# Altium project BMS_ilk_cizim.PrjPcb
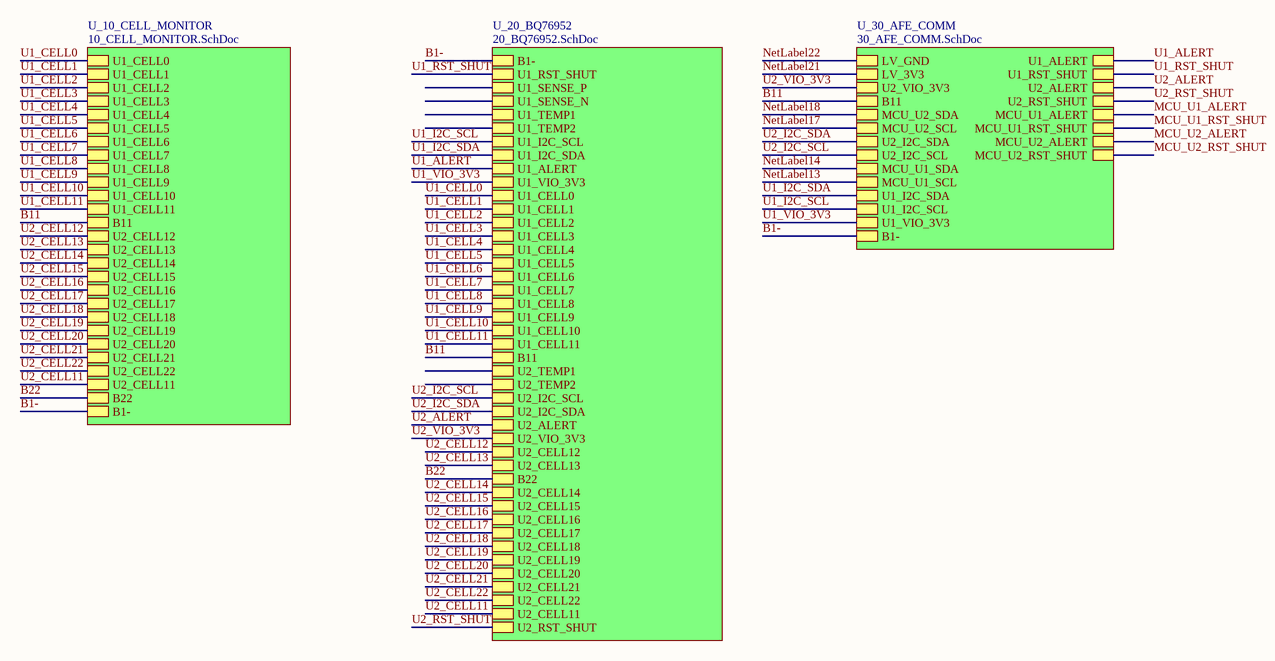
[diagram p0: 00_BMS_TOP.SchDoc]
4 sheets, 101 parts. Net scope: hierarchical (ports join the sheet entries above them; power ports are global).
Sheets:
  00_BMS_TOP.SchDoc
    U_10_CELL_MONITOR = 10_CELL_MONITOR.SchDoc
    U_20_BQ76952 = 20_BQ76952.SchDoc
    U_30_AFE_COMM = 30_AFE_COMM.SchDoc

## Sheet 00_BMS_TOP.SchDoc
size A4; SheetNumber: 1; SheetTotal: 4

### Sub-sheets
U_10_CELL_MONITOR = 10_CELL_MONITOR.SchDoc: U1_CELL0, U1_CELL1, U1_CELL2, U1_CELL3, U1_CELL4, U1_CELL5, U1_CELL6, U1_CELL7, U1_CELL8, U1_CELL9, U1_CELL10, U1_CELL11, B11, U2_CELL12, U2_CELL13, U2_CELL14, U2_CELL15, U2_CELL16, U2_CELL17, U2_CELL18, U2_CELL19, U2_CELL20, U2_CELL21, U2_CELL22, U2_CELL11, B22, B1-
U_20_BQ76952 = 20_BQ76952.SchDoc: B1-, U1_SENSE_P, U1_SENSE_N, U1_TEMP1, U1_TEMP2, U1_I2C_SCL, U1_I2C_SDA, U1_ALERT, U1_VIO_3V3, U1_CELL0, U1_CELL1, U1_CELL2, U1_CELL3, U1_CELL4, U1_CELL5, U1_CELL6, U1_CELL7, U1_CELL8, U1_CELL9, U1_CELL10, U1_CELL11, B11, U2_TEMP1, U2_TEMP2, U2_I2C_SCL, U2_I2C_SDA, U2_ALERT, U2_VIO_3V3, U2_CELL12, U2_CELL13, B22, U2_CELL14, U2_CELL15, U2_CELL16, U2_CELL17, U2_CELL18, U2_CELL19, U2_CELL20, U2_CELL21, U2_CELL22, U2_CELL11, U2_RST_SHUT, U1_RST_SHUT
U_30_AFE_COMM = 30_AFE_COMM.SchDoc: LV_GND, LV_3V3, U2_VIO_3V3, B11, MCU_U2_SDA, MCU_U2_SCL, U2_I2C_SDA, U2_I2C_SCL, MCU_U1_SDA, MCU_U1_SCL, U1_I2C_SDA, U1_I2C_SCL, U1_VIO_3V3, B1-, U2_ALERT, MCU_U2_ALERT, MCU_U2_RST_SHUT, U2_RST_SHUT, U1_ALERT, MCU_U1_ALERT, MCU_U1_RST_SHUT, U1_RST_SHUT

### Nets
B1-: sheet U_10_CELL_MONITOR/B1-, sheet U_20_BQ76952/B1-, sheet U_30_AFE_COMM/B1-
B11: sheet U_10_CELL_MONITOR/B11, sheet U_20_BQ76952/B11, sheet U_30_AFE_COMM/B11
B22: sheet U_10_CELL_MONITOR/B22, sheet U_20_BQ76952/B22
U1_ALERT: sheet U_20_BQ76952/U1_ALERT, sheet U_30_AFE_COMM/U1_ALERT
U1_CELL0: sheet U_10_CELL_MONITOR/U1_CELL0, sheet U_20_BQ76952/U1_CELL0
U1_CELL1: sheet U_10_CELL_MONITOR/U1_CELL1, sheet U_20_BQ76952/U1_CELL1
U1_CELL2: sheet U_10_CELL_MONITOR/U1_CELL2, sheet U_20_BQ76952/U1_CELL2
U1_CELL3: sheet U_10_CELL_MONITOR/U1_CELL3, sheet U_20_BQ76952/U1_CELL3
U1_CELL4: sheet U_10_CELL_MONITOR/U1_CELL4, sheet U_20_BQ76952/U1_CELL4
U1_CELL5: sheet U_10_CELL_MONITOR/U1_CELL5, sheet U_20_BQ76952/U1_CELL5
U1_CELL6: sheet U_10_CELL_MONITOR/U1_CELL6, sheet U_20_BQ76952/U1_CELL6
U1_CELL7: sheet U_10_CELL_MONITOR/U1_CELL7, sheet U_20_BQ76952/U1_CELL7
U1_CELL8: sheet U_10_CELL_MONITOR/U1_CELL8, sheet U_20_BQ76952/U1_CELL8
U1_CELL9: sheet U_10_CELL_MONITOR/U1_CELL9, sheet U_20_BQ76952/U1_CELL9
U1_CELL10: sheet U_10_CELL_MONITOR/U1_CELL10, sheet U_20_BQ76952/U1_CELL10
U1_CELL11: sheet U_10_CELL_MONITOR/U1_CELL11, sheet U_20_BQ76952/U1_CELL11
U1_I2C_SCL: sheet U_20_BQ76952/U1_I2C_SCL, sheet U_30_AFE_COMM/U1_I2C_SCL
U1_I2C_SDA: sheet U_20_BQ76952/U1_I2C_SDA, sheet U_30_AFE_COMM/U1_I2C_SDA
U1_RST_SHUT: sheet U_20_BQ76952/U1_RST_SHUT, sheet U_30_AFE_COMM/U1_RST_SHUT
U1_VIO_3V3: sheet U_20_BQ76952/U1_VIO_3V3, sheet U_30_AFE_COMM/U1_VIO_3V3
U2_ALERT: sheet U_20_BQ76952/U2_ALERT, sheet U_30_AFE_COMM/U2_ALERT
U2_CELL11: sheet U_10_CELL_MONITOR/U2_CELL11, sheet U_20_BQ76952/U2_CELL11
U2_CELL12: sheet U_10_CELL_MONITOR/U2_CELL12, sheet U_20_BQ76952/U2_CELL12
U2_CELL13: sheet U_10_CELL_MONITOR/U2_CELL13, sheet U_20_BQ76952/U2_CELL13
U2_CELL14: sheet U_10_CELL_MONITOR/U2_CELL14, sheet U_20_BQ76952/U2_CELL14
U2_CELL15: sheet U_10_CELL_MONITOR/U2_CELL15, sheet U_20_BQ76952/U2_CELL15
U2_CELL16: sheet U_10_CELL_MONITOR/U2_CELL16, sheet U_20_BQ76952/U2_CELL16
U2_CELL17: sheet U_10_CELL_MONITOR/U2_CELL17, sheet U_20_BQ76952/U2_CELL17
U2_CELL18: sheet U_10_CELL_MONITOR/U2_CELL18, sheet U_20_BQ76952/U2_CELL18
U2_CELL19: sheet U_10_CELL_MONITOR/U2_CELL19, sheet U_20_BQ76952/U2_CELL19
U2_CELL20: sheet U_10_CELL_MONITOR/U2_CELL20, sheet U_20_BQ76952/U2_CELL20
U2_CELL21: sheet U_10_CELL_MONITOR/U2_CELL21, sheet U_20_BQ76952/U2_CELL21
U2_CELL22: sheet U_10_CELL_MONITOR/U2_CELL22, sheet U_20_BQ76952/U2_CELL22
U2_I2C_SCL: sheet U_20_BQ76952/U2_I2C_SCL, sheet U_30_AFE_COMM/U2_I2C_SCL
U2_I2C_SDA: sheet U_20_BQ76952/U2_I2C_SDA, sheet U_30_AFE_COMM/U2_I2C_SDA
U2_RST_SHUT: sheet U_20_BQ76952/U2_RST_SHUT, sheet U_30_AFE_COMM/U2_RST_SHUT
U2_VIO_3V3: sheet U_20_BQ76952/U2_VIO_3V3, sheet U_30_AFE_COMM/U2_VIO_3V3

## Sheet 10_CELL_MONITOR.SchDoc
size A3; SheetNumber: 2; SheetTotal: 4
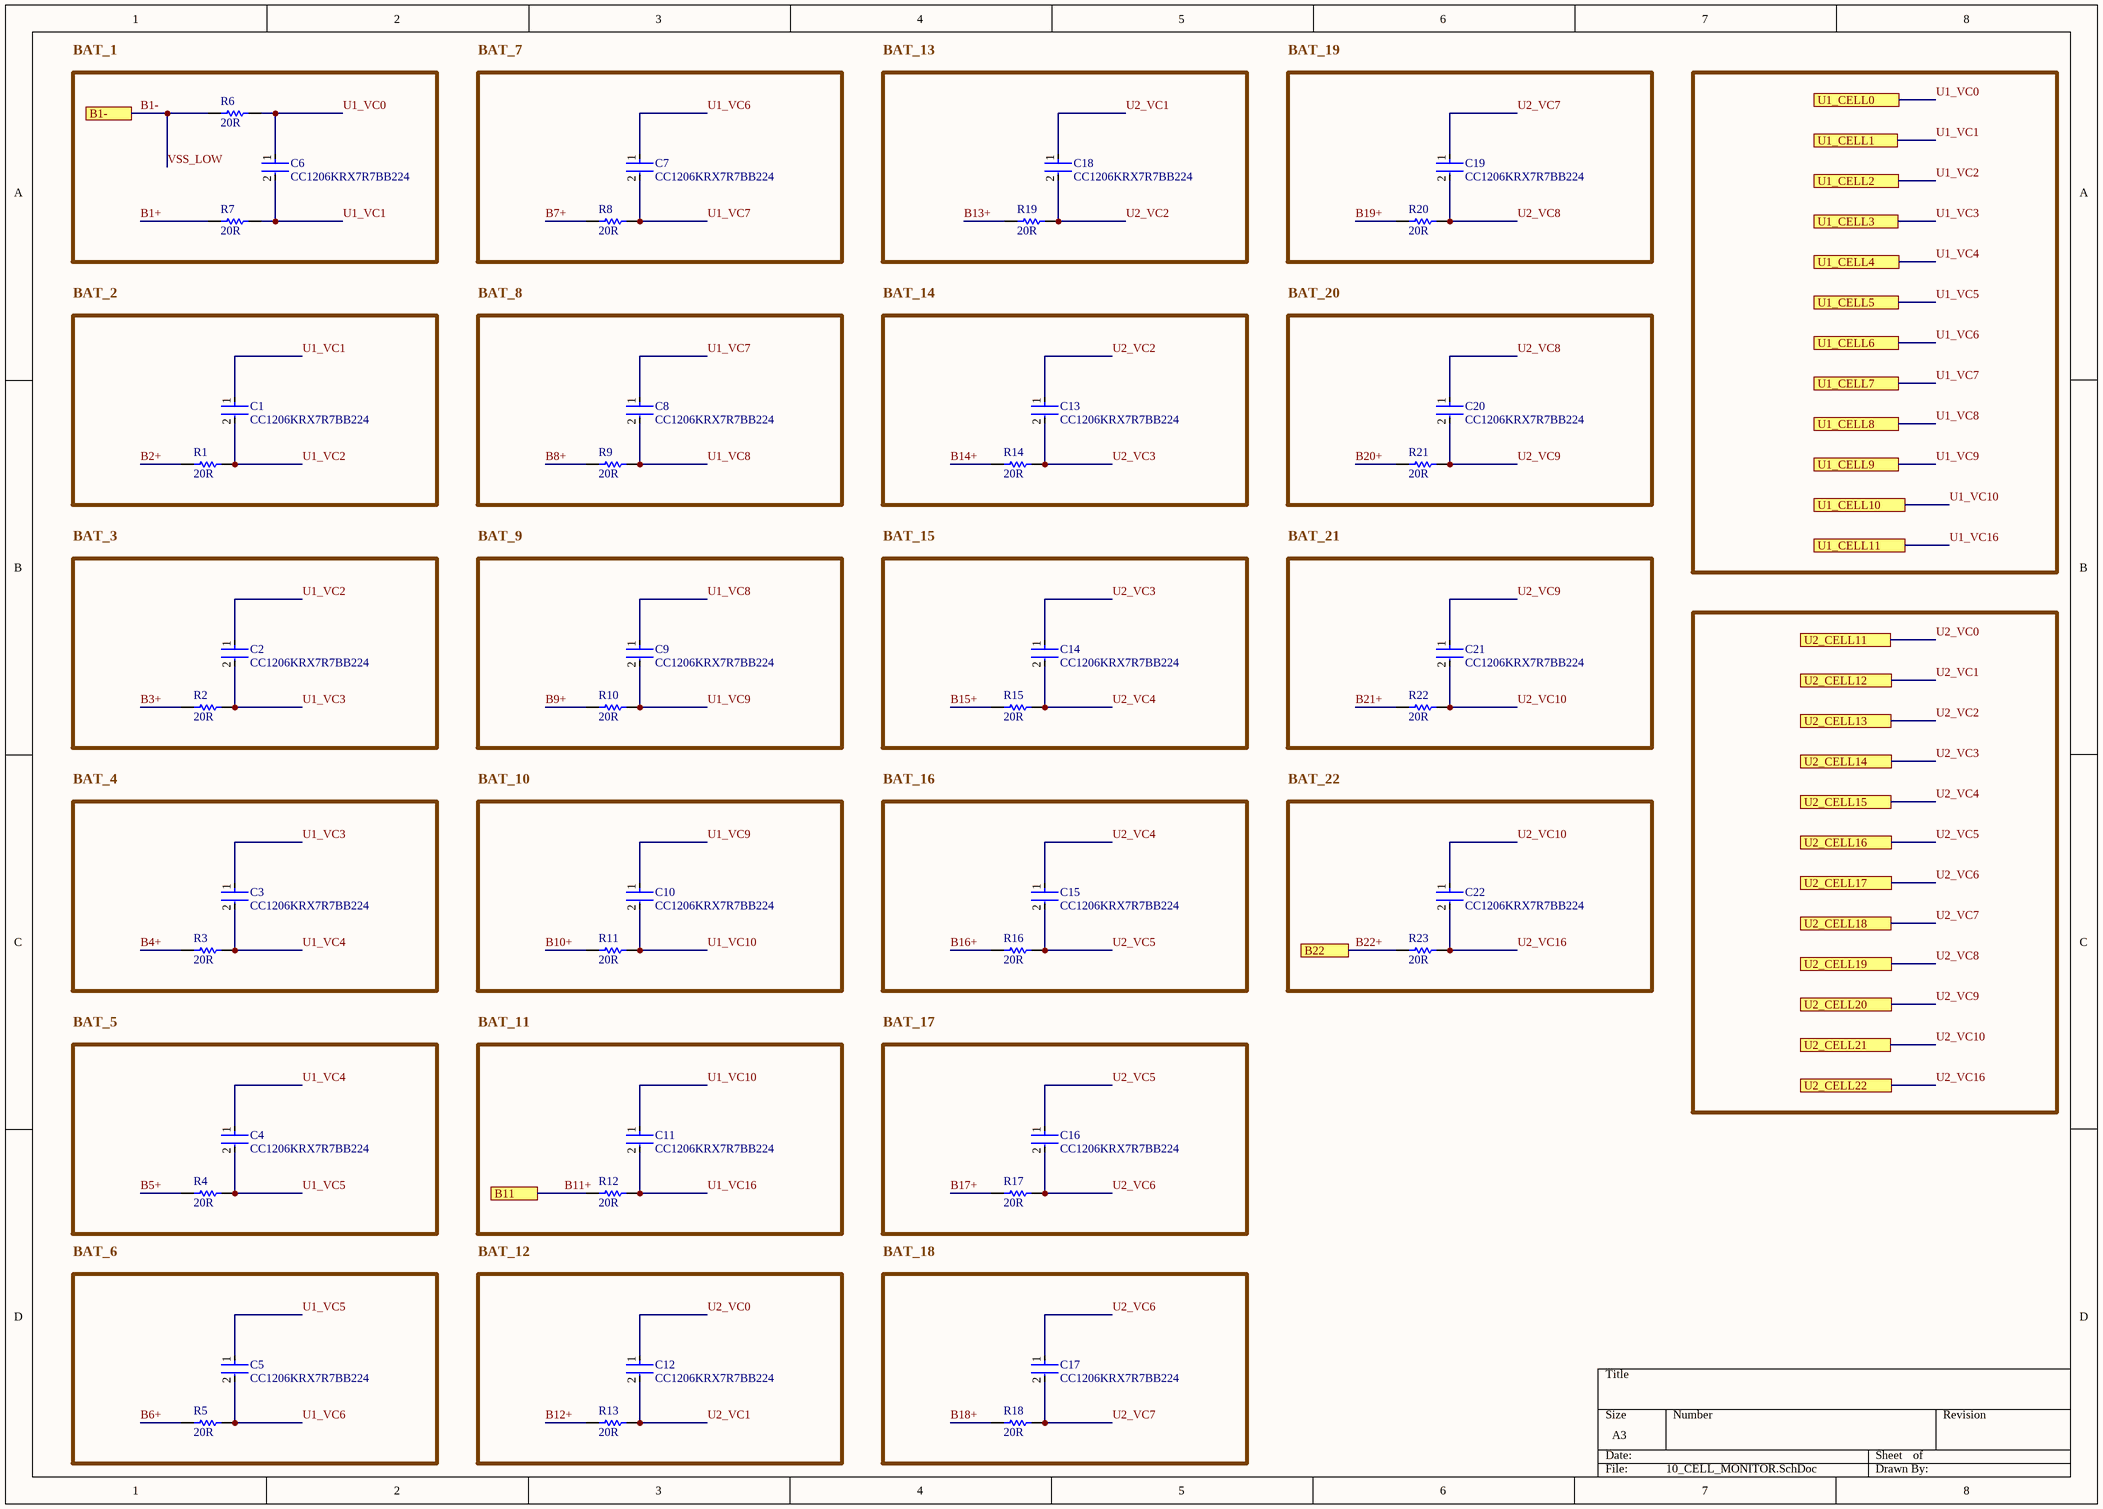
[diagram p1: 10_CELL_MONITOR.SchDoc]

### Parts
C1  CC1206KRX7R7BB224  [FP-CC1206-1_25-MFG]
C2  CC1206KRX7R7BB224  [FP-CC1206-1_25-MFG]
C3  CC1206KRX7R7BB224  [FP-CC1206-1_25-MFG]
C4  CC1206KRX7R7BB224  [FP-CC1206-1_25-MFG]
C5  CC1206KRX7R7BB224  [FP-CC1206-1_25-MFG]
C6  CC1206KRX7R7BB224  [FP-CC1206-1_25-MFG]
C7  CC1206KRX7R7BB224  [FP-CC1206-1_25-MFG]
C8  CC1206KRX7R7BB224  [FP-CC1206-1_25-MFG]
C9  CC1206KRX7R7BB224  [FP-CC1206-1_25-MFG]
C10  CC1206KRX7R7BB224  [FP-CC1206-1_25-MFG]
C11  CC1206KRX7R7BB224  [FP-CC1206-1_25-MFG]
C12  CC1206KRX7R7BB224  [FP-CC1206-1_25-MFG]
C13  CC1206KRX7R7BB224  [FP-CC1206-1_25-MFG]
C14  CC1206KRX7R7BB224  [FP-CC1206-1_25-MFG]
C15  CC1206KRX7R7BB224  [FP-CC1206-1_25-MFG]
C16  CC1206KRX7R7BB224  [FP-CC1206-1_25-MFG]
C17  CC1206KRX7R7BB224  [FP-CC1206-1_25-MFG]
C18  CC1206KRX7R7BB224  [FP-CC1206-1_25-MFG]
C19  CC1206KRX7R7BB224  [FP-CC1206-1_25-MFG]
C20  CC1206KRX7R7BB224  [FP-CC1206-1_25-MFG]
C21  CC1206KRX7R7BB224  [FP-CC1206-1_25-MFG]
C22  CC1206KRX7R7BB224  [FP-CC1206-1_25-MFG]
R1  20R  [RESC3116X65X40LL10T20]
R2  20R  [RESC3116X65X40LL10T20]
R3  20R  [RESC3116X65X40LL10T20]
R4  20R  [RESC3116X65X40LL10T20]
R5  20R  [RESC3116X65X40LL10T20]
R6  20R  [RESC3116X65X40LL10T20]
R7  20R  [RESC3116X65X40LL10T20]
R8  20R  [RESC3116X65X40LL10T20]
R9  20R  [RESC3116X65X40LL10T20]
R10  20R  [RESC3116X65X40LL10T20]
R11  20R  [RESC3116X65X40LL10T20]
R12  20R  [RESC3116X65X40LL10T20]
R13  20R  [RESC3116X65X40LL10T20]
R14  20R  [RESC3116X65X40LL10T20]
R15  20R  [RESC3116X65X40LL10T20]
R16  20R  [RESC3116X65X40LL10T20]
R17  20R  [RESC3116X65X40LL10T20]
R18  20R  [RESC3116X65X40LL10T20]
R19  20R  [RESC3116X65X40LL10T20]
R20  20R  [RESC3116X65X40LL10T20]
R21  20R  [RESC3116X65X40LL10T20]
R22  20R  [RESC3116X65X40LL10T20]
R23  20R  [RESC3116X65X40LL10T20]

### Ports
B1-, B11, B22, U1_CELL0, U1_CELL1, U1_CELL2, U1_CELL3, U1_CELL4, U1_CELL5, U1_CELL6, U1_CELL7, U1_CELL8, U1_CELL9, U1_CELL10, U1_CELL11, U2_CELL11, U2_CELL12, U2_CELL13, U2_CELL14, U2_CELL15, U2_CELL16, U2_CELL17, U2_CELL18, U2_CELL19, U2_CELL20, U2_CELL21, U2_CELL22

### Nets
B1+: R7.1
B1-: R6.1 ; port B1-  [also labelled VSS_LOW]
B2+: R1.1
B3+: R2.1
B4+: R3.1
B5+: R4.1
B6+: R5.1
B7+: R8.1
B8+: R9.1
B9+: R10.1
B10+: R11.1
B11+: R12.1 ; port B11  [project net B11]
B12+: R13.1
B13+: R19.1
B14+: R14.1
B15+: R15.1
B16+: R16.1
B17+: R17.1
B18+: R18.1
B19+: R20.1
B20+: R21.1
B21+: R22.1
B22+: R23.1 ; port B22  [project net B22]
U1_VC0: C6.1 R6.2 ; port U1_CELL0  [project net U1_CELL0]
U1_VC1: C1.1 C6.2 R7.2 ; port U1_CELL1  [project net U1_CELL1]
U1_VC2: C1.2 C2.1 R1.2 ; port U1_CELL2  [project net U1_CELL2]
U1_VC3: C2.2 C3.1 R2.2 ; port U1_CELL3  [project net U1_CELL3]
U1_VC4: C3.2 C4.1 R3.2 ; port U1_CELL4  [project net U1_CELL4]
U1_VC5: C4.2 C5.1 R4.2 ; port U1_CELL5  [project net U1_CELL5]
U1_VC6: C5.2 C7.1 R5.2 ; port U1_CELL6  [project net U1_CELL6]
U1_VC7: C7.2 C8.1 R8.2 ; port U1_CELL7  [project net U1_CELL7]
U1_VC8: C8.2 C9.1 R9.2 ; port U1_CELL8  [project net U1_CELL8]
U1_VC9: C9.2 C10.1 R10.2 ; port U1_CELL9  [project net U1_CELL9]
U1_VC10: C10.2 C11.1 R11.2 ; port U1_CELL10  [project net U1_CELL10]
U1_VC16: C11.2 R12.2 ; port U1_CELL11  [project net U1_CELL11]
U2_VC0: C12.1 ; port U2_CELL11  [project net U2_CELL11]
U2_VC1: C12.2 C18.1 R13.2 ; port U2_CELL12  [project net U2_CELL12]
U2_VC2: C13.1 C18.2 R19.2 ; port U2_CELL13  [project net U2_CELL13]
U2_VC3: C13.2 C14.1 R14.2 ; port U2_CELL14  [project net U2_CELL14]
U2_VC4: C14.2 C15.1 R15.2 ; port U2_CELL15  [project net U2_CELL15]
U2_VC5: C15.2 C16.1 R16.2 ; port U2_CELL16  [project net U2_CELL16]
U2_VC6: C16.2 C17.1 R17.2 ; port U2_CELL17  [project net U2_CELL17]
U2_VC7: C17.2 C19.1 R18.2 ; port U2_CELL18  [project net U2_CELL18]
U2_VC8: C19.2 C20.1 R20.2 ; port U2_CELL19  [project net U2_CELL19]
U2_VC9: C20.2 C21.1 R21.2 ; port U2_CELL20  [project net U2_CELL20]
U2_VC10: C21.2 C22.1 R22.2 ; port U2_CELL21  [project net U2_CELL21]
U2_VC16: C22.2 R23.2 ; port U2_CELL22  [project net U2_CELL22]

### Notes on the sheet
- Labels drawn without touching a wire or pin: BAT_1, BAT_2, BAT_3, BAT_4, BAT_5, BAT_6, BAT_7, BAT_8, BAT_9, BAT_10, BAT_11, BAT_12, BAT_13, BAT_14, BAT_15, BAT_16, BAT_17, BAT_18, BAT_19, BAT_20, BAT_21, BAT_22

### Library data of the parts
C1-C22 = CMP-1037-04366-2: CAP CER 0.22UF 16V X7R 1206; Manufacturer: Yageo; Automotive Grade: NA; Temperature Coefficient: 15%; Tolerance: 0.1; Value: 220 nF; Material: Ceramic; Temperature Range High: +125°C; Device Class L1: Passive Components; Octopart: https://octopart.com/cc1206krx7r7bb224-yageo-42522915; Automotive: No; Package: CC1206-1.25; Digikey Description: CAP CER 0.22UF 16V X7R 1206; RoHS: TRUE; Temperature Range Low: -55°C; Device Class L2: Capacitors; Manufacturer Part Number: CC1206KRX7R7BB224; Height: 1.45mm; Footprint Url: http://www.yageo.com/exep/pages/download/literatures/UPY-C_GEN_24.pdf; Temperature Characteristic: X7R; ComponentLink2URL: http://www.yageo.com/documents/recent/UPY-NP0X7R_HV_1KV-to-3KV_11.pdf; ComponentLink2Description: Datasheet; Mouser Description: Multilayer Ceramic Capacitors MLCC - SMD/SMT 220nF 16V X7R 10%; Voltage Rating: 16 V; Lead Free: Yes; Temperature: -55°C to +125°C; Capacitance: 220 nF; Category: Cap; Device Class L3: Ceramic Capacitors
R1-R23 = CMP-2003-04964-1: Part Number: RT1206FRE0720RL; Manufacturer: Yageo

## Sheet 20_BQ76952.SchDoc
size A3; SheetNumber: 3; SheetTotal: 4
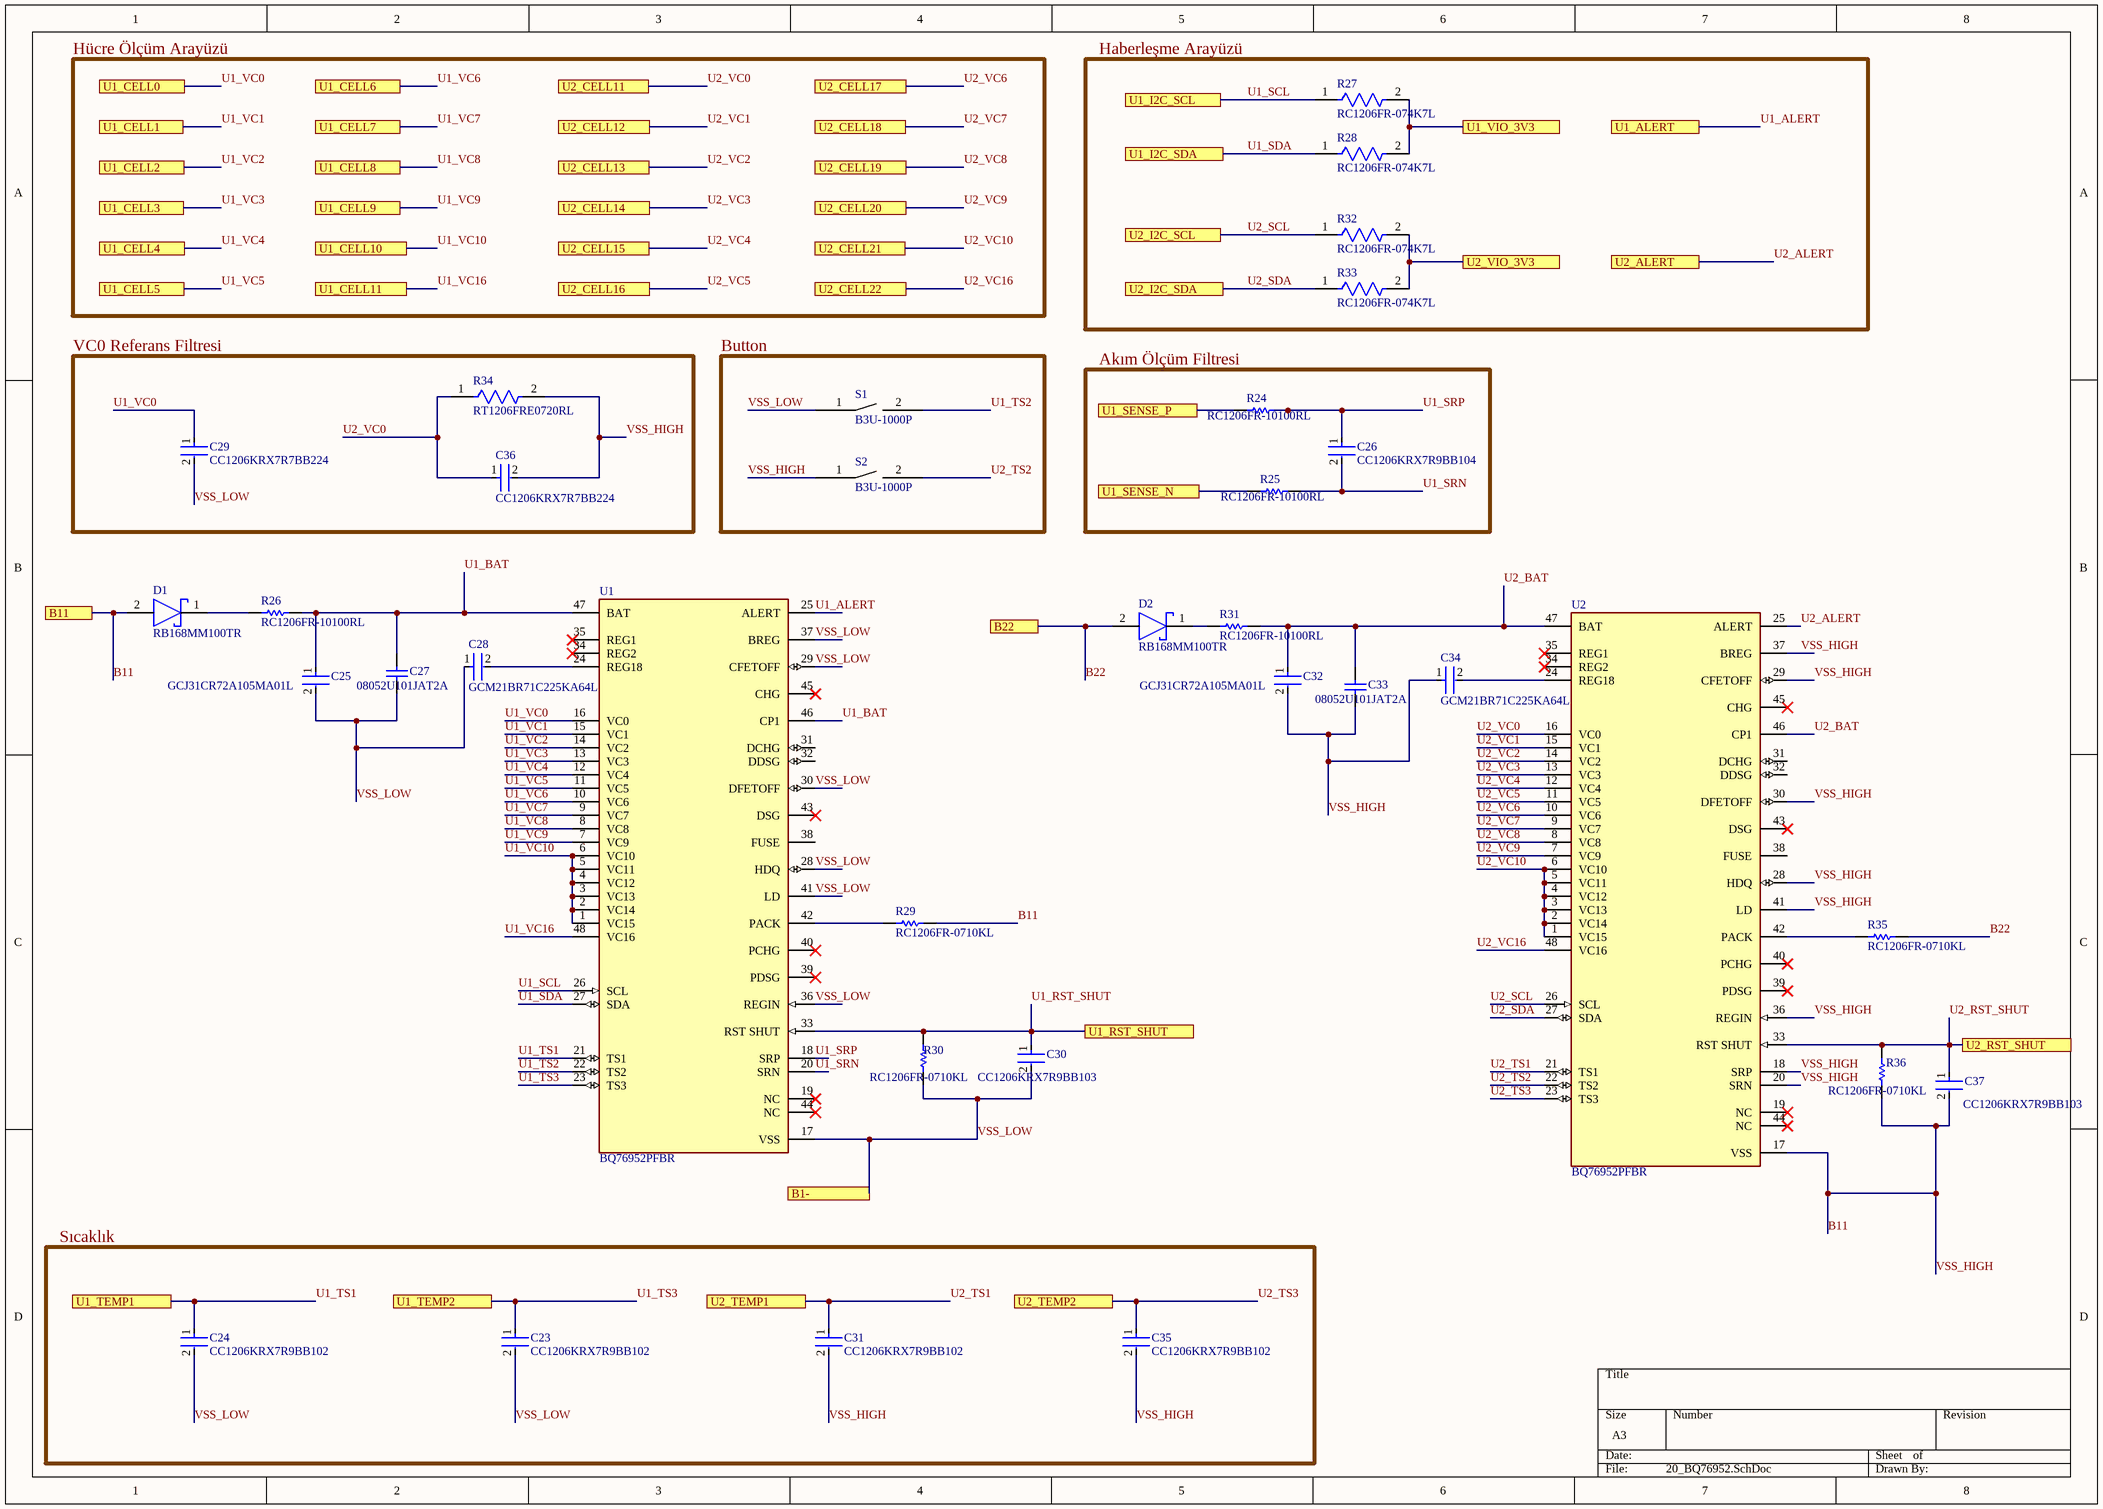
[diagram p2: 20_BQ76952.SchDoc]

### Parts
C23  CC1206KRX7R9BB102  [FP-CC1206-1_25-MFG]
C24  CC1206KRX7R9BB102  [FP-CC1206-1_25-MFG]
C25  GCJ31CR72A105MA01L  [FP-GCJ31C-0_3-IPC_A]
C26  CC1206KRX7R9BB104  [FP-CC1206-1_25-MFG]
C27  08052U101JAT2A  [CAPC2013X115X51ML20T26]
C28  GCM21BR71C225KA64L  [FP-GCM21B-0_15-IPC_B]
C29  CC1206KRX7R7BB224  [FP-CC1206-1_25-MFG]
C30  CC1206KRX7R9BB103  [FP-CC1206-1_25-MFG]
C31  CC1206KRX7R9BB102  [FP-CC1206-1_25-MFG]
C32  GCJ31CR72A105MA01L  [FP-GCJ31C-0_3-IPC_A]
C33  08052U101JAT2A  [CAPC2013X115X51ML20T26]
C34  GCM21BR71C225KA64L  [FP-GCM21B-0_15-IPC_B]
C35  CC1206KRX7R9BB102  [FP-CC1206-1_25-MFG]
C36  CC1206KRX7R7BB224  [FP-CC1206-1_25-MFG]
C37  CC1206KRX7R9BB103  [FP-CC1206-1_25-MFG]
D1  RB168MM100TR  [FP-PMDU-MFG]
D2  RB168MM100TR  [FP-PMDU-MFG]
R24  RC1206FR-10100RL  [RESC3116X65X40NL10T20]
R25  RC1206FR-10100RL  [RESC3116X65X40NL10T20]
R26  RC1206FR-10100RL  [RESC3116X65X40NL10T20]
R27  RC1206FR-074K7L  [FP-RC1206-0_65-IPC_B]
R28  RC1206FR-074K7L  [FP-RC1206-0_65-IPC_B]
R29  RC1206FR-0710KL  [RESC3116X65X40ML10T20]
R30  RC1206FR-0710KL  [RESC3116X65X40ML10T20]
R31  RC1206FR-10100RL  [RESC3116X65X40NL10T20]
R32  RC1206FR-074K7L  [FP-RC1206-0_65-IPC_B]
R33  RC1206FR-074K7L  [FP-RC1206-0_65-IPC_B]
R34  RT1206FRE0720RL  [FP-RT1206-MFG]
R35  RC1206FR-0710KL  [RESC3116X65X40ML10T20]
R36  RC1206FR-0710KL  [RESC3116X65X40ML10T20]
S1  B3U-1000P  [SW_B3U_1000P]
S2  B3U-1000P  [SW_B3U_1000P]
U1  BQ76952PFBR  [FP-PFB0048A-IPC_B]
U2  BQ76952PFBR  [FP-PFB0048A-IPC_B]

### Ports
B1-, B11, B22, U1_ALERT, U1_CELL0, U1_CELL1, U1_CELL2, U1_CELL3, U1_CELL4, U1_CELL5, U1_CELL6, U1_CELL7, U1_CELL8, U1_CELL9, U1_CELL10, U1_CELL11, U1_I2C_SCL, U1_I2C_SDA, U1_RST_SHUT, U1_SENSE_N, U1_SENSE_P, U1_TEMP1, U1_TEMP2, U1_VIO_3V3, U2_ALERT, U2_CELL11, U2_CELL12, U2_CELL13, U2_CELL14, U2_CELL15, U2_CELL16, U2_CELL17, U2_CELL18, U2_CELL19, U2_CELL20, U2_CELL21, U2_CELL22, U2_I2C_SCL, U2_I2C_SDA, U2_RST_SHUT, U2_TEMP1, U2_TEMP2, U2_VIO_3V3

### Nets
B11: C31.2 C32.2 C33.1 C34.1 C35.2 C36.2 C37.2 D1.2(A) R29.2 R34.2 R36.1 S2.1 U2.17(VSS) U2.18(SRP) U2.20(SRN) U2.28(HDQ) U2.29(CFETOFF) U2.30(DFETOFF) U2.36(REGIN) U2.37(BREG) U2.41(LD) ; port B11  [also labelled VSS_HIGH]
B22: D2.2(A) R35.2 ; port B22
U1_ALERT: U1.25(ALERT) ; port U1_ALERT
U1_BAT: C25.1 C27.2 R26.2 U1.46(CP1) U1.47(BAT)
U1_RST_SHUT: C30.1 R30.2 U1.33(RST_SHUT) ; port U1_RST_SHUT
U1_SCL: R27.1 U1.26(SCL) ; port U1_I2C_SCL  [project net U1_I2C_SCL]
U1_SDA: R28.1 U1.27(SDA) ; port U1_I2C_SDA  [project net U1_I2C_SDA]
U1_SRN: C26.2 R25.2 U1.20(SRN)
U1_SRP: C26.1 R24.2 U1.18(SRP)
U1_TS1: C24.1 U1.21(TS1) ; port U1_TEMP1
U1_TS2: S1.2 U1.22(TS2)
U1_TS3: C23.1 U1.23(TS3) ; port U1_TEMP2
U1_VC0: C29.1 U1.16(VC0) ; port U1_CELL0  [project net U1_CELL0]
U1_VC1: U1.15(VC1) ; port U1_CELL1  [project net U1_CELL1]
U1_VC2: U1.14(VC2) ; port U1_CELL2  [project net U1_CELL2]
U1_VC3: U1.13(VC3) ; port U1_CELL3  [project net U1_CELL3]
U1_VC4: U1.12(VC4) ; port U1_CELL4  [project net U1_CELL4]
U1_VC5: U1.11(VC5) ; port U1_CELL5  [project net U1_CELL5]
U1_VC6: U1.10(VC6) ; port U1_CELL6  [project net U1_CELL6]
U1_VC7: U1.9(VC7) ; port U1_CELL7  [project net U1_CELL7]
U1_VC8: U1.8(VC8) ; port U1_CELL8  [project net U1_CELL8]
U1_VC9: U1.7(VC9) ; port U1_CELL9  [project net U1_CELL9]
U1_VC10: U1.1(VC15) U1.2(VC14) U1.3(VC13) U1.4(VC12) U1.5(VC11) U1.6(VC10) ; port U1_CELL10  [project net U1_CELL10]
U1_VC16: U1.48(VC16) ; port U1_CELL11  [project net U1_CELL11]
U1_VIO_3V3: R27.2 R28.2 ; port U1_VIO_3V3
U2_ALERT: U2.25(ALERT) ; port U2_ALERT
U2_BAT: C32.1 C33.2 R31.2 U2.46(CP1) U2.47(BAT)
U2_RST_SHUT: C37.1 R36.2 U2.33(RST_SHUT) ; port U2_RST_SHUT
U2_SCL: R32.1 U2.26(SCL) ; port U2_I2C_SCL  [project net U2_I2C_SCL]
U2_SDA: R33.1 U2.27(SDA) ; port U2_I2C_SDA  [project net U2_I2C_SDA]
U2_TS1: C31.1 U2.21(TS1) ; port U2_TEMP1
U2_TS2: S2.2 U2.22(TS2)
U2_TS3: C35.1 U2.23(TS3) ; port U2_TEMP2
U2_VC0: C36.1 R34.1 U2.16(VC0) ; port U2_CELL11  [project net U2_CELL11]
U2_VC1: U2.15(VC1) ; port U2_CELL12  [project net U2_CELL12]
U2_VC2: U2.14(VC2) ; port U2_CELL13  [project net U2_CELL13]
U2_VC3: U2.13(VC3) ; port U2_CELL14  [project net U2_CELL14]
U2_VC4: U2.12(VC4) ; port U2_CELL15  [project net U2_CELL15]
U2_VC5: U2.11(VC5) ; port U2_CELL16  [project net U2_CELL16]
U2_VC6: U2.10(VC6) ; port U2_CELL17  [project net U2_CELL17]
U2_VC7: U2.9(VC7) ; port U2_CELL18  [project net U2_CELL18]
U2_VC8: U2.8(VC8) ; port U2_CELL19  [project net U2_CELL19]
U2_VC9: U2.7(VC9) ; port U2_CELL20  [project net U2_CELL20]
U2_VC10: U2.1(VC15) U2.2(VC14) U2.3(VC13) U2.4(VC12) U2.5(VC11) U2.6(VC10) ; port U2_CELL21  [project net U2_CELL21]
U2_VC16: U2.48(VC16) ; port U2_CELL22  [project net U2_CELL22]
U2_VIO_3V3: R32.2 R33.2 ; port U2_VIO_3V3
VSS_LOW: C23.2 C24.2 C25.2 C27.1 C28.1 C29.2 C30.2 R30.1 S1.1 U1.17(VSS) U1.28(HDQ) U1.29(CFETOFF) U1.30(DFETOFF) U1.36(REGIN) U1.37(BREG) U1.41(LD) ; port B1-  [project net B1-]
NetC28_2: C28.2 U1.24(REG18)
NetC34_2: C34.2 U2.24(REG18)
NetD1_1: D1.1(C) R26.1
NetD2_1: D2.1(C) R31.1
NetR24_1: R24.1 ; port U1_SENSE_P
NetR25_1: R25.1 ; port U1_SENSE_N
NetR29_1: R29.1 U1.42(PACK)
NetR35_1: R35.1 U2.42(PACK)

Not connected (* = marked no-connect by the designer): U1 19(NC)* 31(DCHG) 32(DDSG) 34(REG2)* 35(REG1)* 38(FUSE) 39(PDSG)* 40(PCHG)* 43(DSG)* 44(NC)* 45(CHG)*; U2 19(NC)* 31(DCHG) 32(DDSG) 34(REG2)* 35(REG1)* 38(FUSE) 39(PDSG)* 40(PCHG)* 43(DSG)* 44(NC)* 45(CHG)*

### Notes on the sheet
- Labels drawn without touching a wire or pin: Akım Ölçüm Filtresi, Button, Haberleşme Arayüzü, Hücre Ölçüm Arayüzü, Sıcaklık, VC0 Referans Filtresi

### Library data of the parts
C23 C24 C31 C35 = CMP-03422-000488-1: CAP CER 1000PF 50V X7R 1206; Manufacturer: Yageo; Capacitance: 1.0 nF; Temperature Coefficient: 15%; Automotive Grade: NA; Material: Ceramic; Value: 1.0 nF; Tolerance: 0.1; Category: Cap; Temperature Characteristic: X7R; Voltage Rating: 50 V; RoHS: TRUE; Package: CC1206-1.25; Mouser Description: Multilayer Ceramic Capacitors MLCC - SMD/SMT 1000PF 50V 10% 1206; Footprint Url: http://www.yageo.com/exep/pages/download/literatures/UPY-C_GEN_24.pdf; Lead Free: Yes; Digikey Description: CAP CER 1000PF 50V X7R 1206; Device Class L1: Passive Components; ComponentLink2URL: http://www.yageo.com/documents/recent/UPY-NP0X7R_HV_1KV-to-3KV_11.pdf; Temperature Range Low: -55°C; Octopart: https://octopart.com/cc1206krx7r9bb102-yageo-193023; Automotive: No; Height: 1.45mm; Device Class L3: Ceramic Capacitors; ComponentLink2Description: Datasheet; Temperature: -55°C to +125°C; Device Class L2: Capacitors; Manufacturer Part Number: CC1206KRX7R9BB102; Temperature Range High: +125°C
C25 C32 = CMP-06035-003057-1: Cap Ceramic 1uF 100V X7R 20% Pad SMD 1206 Soft Termination  +125°C Automotive T/R
C26 = CMP-03422-000842-1: CAP CER 0.1UF 50V X7R 1206; Manufacturer: Yageo; Automotive Grade: NA; Value: 100 nF; Tolerance: 0.1; Material: Ceramic; Temperature Coefficient: 15%; Temperature Characteristic: X7R; Device Class L1: Passive Components; Lead Free: Yes; Octopart: https://octopart.com/cc1206krx7r9bb104-yageo-39467816; Category: Cap; Temperature Range Low: -55°C; Device Class L3: Ceramic Capacitors; Voltage Rating: 50 V; Temperature Range High: +125°C; Device Class L2: Capacitors; RoHS: TRUE; Package: CC1206-1.25; Footprint Url: http://www.yageo.com/exep/pages/download/literatures/UPY-C_GEN_24.pdf; ComponentLink2Description: Datasheet; Temperature: -55°C to +125°C; Capacitance: 100 nF; Digikey Description: CAP CER 0.1UF 50V X7R 1206; Height: 1.45mm; Automotive: No; Mouser Description: Multilayer Ceramic Capacitors MLCC - SMD/SMT 100nF 50V X7R 10%; ComponentLink2URL: http://www.yageo.com/documents/recent/UPY-NP0X7R_HV_1KV-to-3KV_11.pdf; Manufacturer Part Number: CC1206KRX7R9BB104
C27 C33 = CMP-2007-04861-1: Manufacturer: AVX Interconnect / Elco; Part Number: 08052U101JAT2A
C28 C34 = CMP-2007-03338-2: Ceramic Capacitor for Automotive 2.2uF ±10% 16VDC X7R 0805 Embossed T/R; Voltage: 16V; Case Code (Metric): 2012; Capacitance: 2.2uF; Width: 0.049inch; Package Quantity: 1; Case Code (Imperial): 0805; Packaging: Tape and Reel; Lead Free: Lead Free; Ratings: AEC-Q200; Mount: Surface Mount; Termination: SMD/SMT; Depth: 1.25mm; Tolerance: 10%; Case/Package: 0805; Dielectric: X7R; Length: 2mm; Radiation Hardening: No; REACH SVHC: No SVHC; Voltage Rating (DC): 16V; Voltage Rating: 16V; Height: 1.25mm; Min Operating Temperature: -55°C; Thickness: 0.055inch; Max Operating Temperature: 125°C
C29 C36 = CMP-1037-04366-2: as C1 on sheet 10_CELL_MONITOR; Temperature Range High: +125°C; Device Class L1: Passive Components; Octopart: https://octopart.com/cc1206krx7r7bb224-yageo-42522915; Automotive: No; Package: CC1206-1.25; Digikey Description: CAP CER 0.22UF 16V X7R 1206; RoHS: TRUE; Temperature Range Low: -55°C; Device Class L2: Capacitors; Manufacturer Part Number: CC1206KRX7R7BB224; Height: 1.45mm; Footprint Url: http://www.yageo.com/exep/pages/download/literatures/UPY-C_GEN_24.pdf; Temperature Characteristic: X7R; ComponentLink2URL: http://www.yageo.com/documents/recent/UPY-NP0X7R_HV_1KV-to-3KV_11.pdf; ComponentLink2Description: Datasheet; Mouser Description: Multilayer Ceramic Capacitors MLCC - SMD/SMT 220nF 16V X7R 10%; Voltage Rating: 16 V; Lead Free: Yes; Temperature: -55°C to +125°C; Capacitance: 220 nF; Category: Cap; Device Class L3: Ceramic Capacitors
C30 C37 = CMP-1037-03511-2: CAP CER 10000PF 50V X7R 1206; Manufacturer: Yageo; Automotive Grade: NA; Temperature Coefficient: 15%; Tolerance: 0.1; Capacitance: 10 nF; Value: 10 nF; Material: Ceramic; RoHS: TRUE; Lead Free: Yes; Category: Cap; Temperature Characteristic: X7R; ComponentLink2Description: Datasheet; Device Class L2: Capacitors; Voltage Rating: 50 V; Octopart: https://octopart.com/cc1206krx7r9bb103-yageo-39467800; Temperature Range Low: -55°C; Digikey Description: CAP CER 10000PF 50V X7R 1206; ComponentLink2URL: http://www.yageo.com/documents/recent/UPY-NP0X7R_HV_1KV-to-3KV_11.pdf; Package: CC1206-1.25; Height: 1.45mm; Automotive: No; Mouser Description: Multilayer Ceramic Capacitors MLCC - SMD/SMT 10nF 50V X7R 10%; Temperature Range High: +125°C; Manufacturer Part Number: CC1206KRX7R9BB103; Device Class L3: Ceramic Capacitors; Temperature: -55°C to +125°C; Footprint Url: http://www.yageo.com/exep/pages/download/literatures/UPY-C_GEN_24.pdf; Device Class L1: Passive Components
D1 D2 = CMP-08971-000001-1: DIODE SCHOTTKY 100V 1A SOD123FL; Manufacturer: ROHM Semiconductor; Max Surge Forward Current: 40A; Max Junction Temp: +150°C; Peak Reverse Current: 0.4uA; Reverse Voltage: 100V; Octopart: https://octopart.com/rb168mm100tr-rohm-66788706; Device Class L2: Diodes; Temperature Range High: +150°C; Forward Current: 1A; ComponentLink2URL: https://d1d2qsbl8m0m72.cloudfront.net/en/products/databook/datasheet/discrete/diode/schottky_barrier/rb168mm100tr-e.pdf; Category: Diode; Max Repetitive Reverse Voltage: 100V; RoHS: TRUE; Mouser Description: On a Reel of 3000, ROHM 100V 1A, Schottky Diode, 2-Pin SOD-123FL RB168MM100TR; Package: PMDU; Device Class L3: Schottky Diodes; Manufacturer Part Number: RB168MM100TR; Temperature: to +150°C; Lead Free: Yes; Device Class L1: Discrete Semiconductors; Digikey Description: DIODE SCHOTTKY 100V 1A SOD123FL; Automotive: No; Height: 0.9mm; ComponentLink2Description: Datasheet
R24-R26 R31 = CMP-2003-04959-1: Manufacturer: Yageo; Part Number: RC1206FR-10100RL
R27 R28 R32 R33 = CMP-03412-037805-1: RES SMD 4.7K OHM 1% 1/4W 1206; Max Power Dissipation: 250mW; Voltage Rating: 200V; Temperature Coefficient: 100ppm/°C; Resistance: 4.7kR; Construction: Rectangular; RoHS Compliant: Yes; Max Operating Temperature: 155°C; Tolerance: 1%; Height: 0.026inch; Features: Moisture Resistant; Military Standard: Not; Series: RC; Termination: SMD/SMT; Number of Terminations: 2; Number of Pins: 2; Case Code (Imperial): 1206; Case/Package: 1206; Case Code (Metric): 3216; Voltage Rating (DC): 200V; Width: 0.063inch; Min Operating Temperature: -55°C; Resistance Tolerance: 1%; Length: 0.122inch; Size Code: 1206; Lead Free: Lead Free; Depth: 1.6mm; Packaging: Tape and Reel; Package Quantity: 1; Power Rating: 250mW; Resistor Type: Thick Film
R29 R30 R35 R36 = CMP-1014-00623-2: Chip Resistor, 10 KOhm, +/- 1%, 0.25 W, -55 to 155 degC, 1206 (3216 Metric), RoHS, Tape and Reel; Manufacturer: Yageo; Voltage Rating: 200V; Resistance: 10KOhm; Temperature Coefficient: 100ppm/degreesC; Power Rating: 250mW; Packaging: TapeandReel; Termination: SMD/SMT; REACH SVHC: Unknown; Tolerance: 1%; Height: 0.55mm; Composition: ThickFilm; Max Operating Temperature: 155degC; Datasheet Version: Rev. 5, 10/2016; Lead Free: LeadFree; Case Code (Metric): 3216; Depth: 1.6mm; Package Quantity: 5000; RoHSCompliant: true; Military Standard: Not; Case/Package: 1206; Case Code (Imperial): 1206; Min Operating Temperature: -55degC; Datasheet URL: http://www.yageo.com/NewPortal/yageodocoutput?fileName=/pdf/R-Chip/PYu-RC_Group_51_RoHS_L_5.pdf; Length: 3.1mm; Manufacturer URL: http://www.yageo.com/; Package Reference: 1206.0; Width: 1.6mm; Package Description: 2-Pin Surface Mount Device, Body 3.1 x 1.6 mm
R34 = CMP-2003-04100-2: RES SMD 20 OHM 1% 1/4W 1206; Manufacturer: Yageo; Resistance: 20Ω; Voltage Rating: 200V; Power Rating: 0.25W; Tolerance: 0.0002; Value: 20Ω; Temperature Coefficient: 50 ppm/°C; RoHS: TRUE; Category: Res; Temperature: -55°C to +155°C; Temperature Range High: +155°C; Automotive: No; Package: RT1206; Composition: Thin Film; ComponentLink2URL: http://www.yageo.com/documents/recent/PYu-RT_1-to-0.01_RoHS_L_9.pdf; Series: RT; Device Class L3: Chip SMD Resistors; Digikey Description: RES SMD 20 OHM 1% 1/4W 1206; ComponentLink2Description: Datasheet; Octopart: https://octopart.com/rt1206fre0720rl-yageo-1235386; Footprint Url: http://www.yageo.com/exep/pages/download/literatures/PYu-R_Mount_10.pdf; Manufacturer Part Number: RT1206FRE0720RL; Lead Free: Yes; Device Class L1: Passive Components; Ipc Land Pattern Name: RESC310160X55; Mouser Description: Thin Film Resistors - SMD 1/4W 20 ohm 1% 50ppm; Height: 0.65mm; Device Class L2: Resistors; Temperature Range Low: -55°C
S1 S2 = B3U-1000P: Normally open momentary pushbutton
U1 U2 = CMP-04911-000082-1: IC BAT LIFEPO4/LI-ION 3-16C TQFP; RoHS Compliant: Yes

## Sheet 30_AFE_COMM.SchDoc
size A3; SheetNumber: 4; SheetTotal: 4
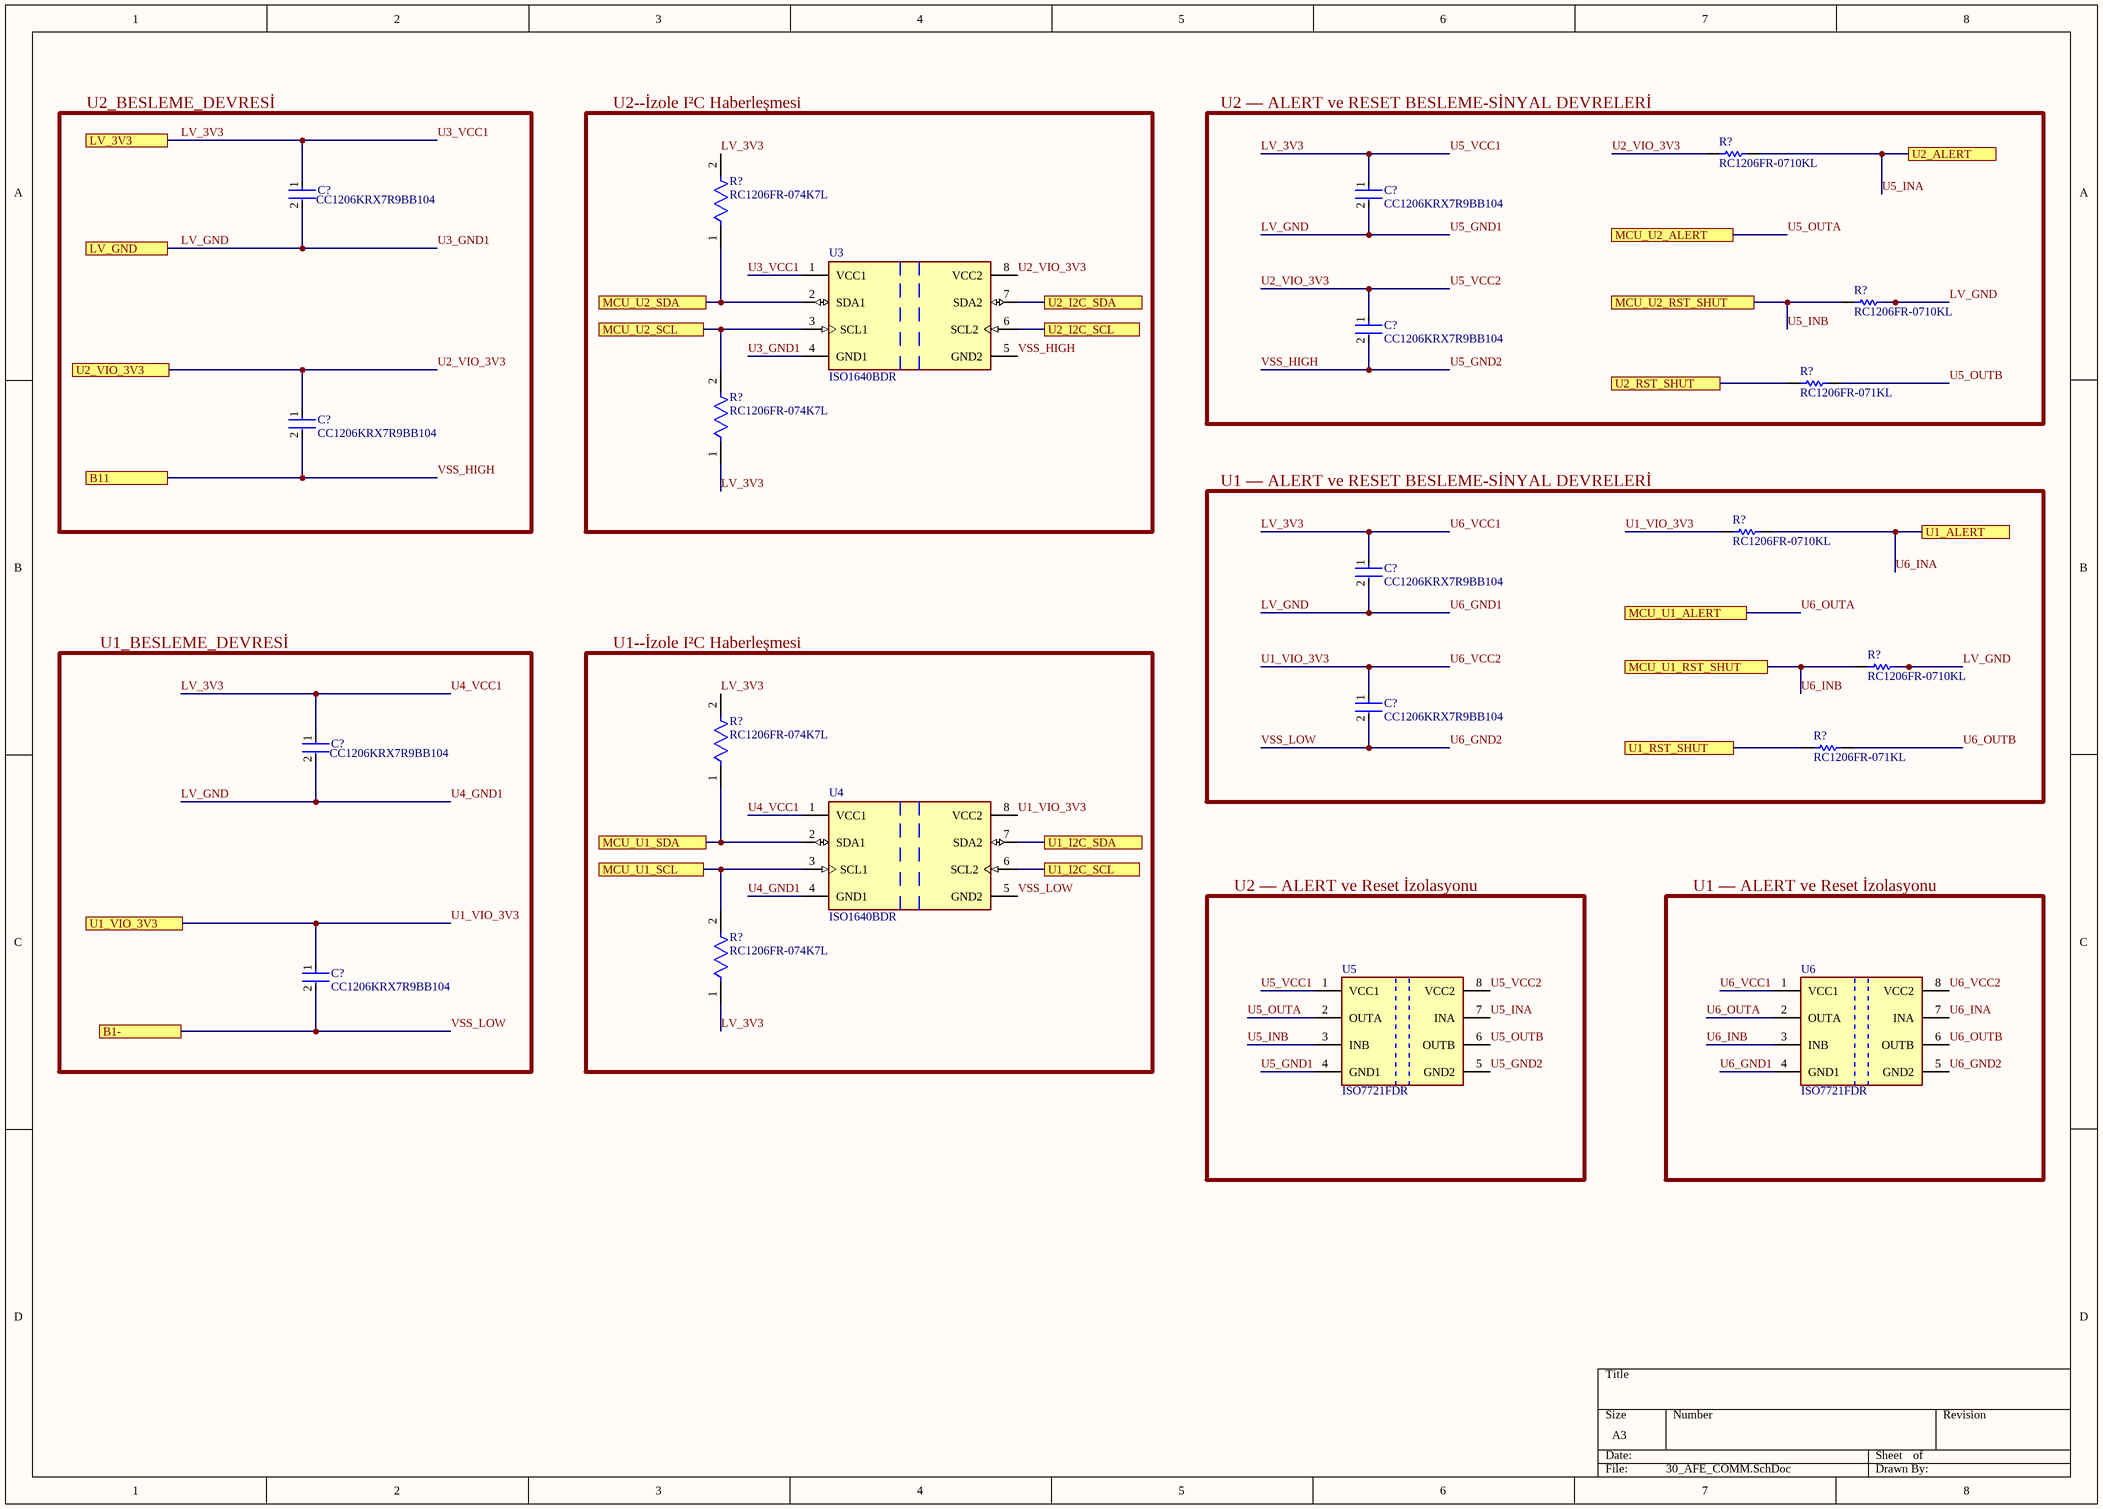
[diagram p3: 30_AFE_COMM.SchDoc]

### Parts
(Parts that share a designator on the sheet are numbered #1, #2 ... from top to bottom, then left to right.)
C?#1  CC1206KRX7R9BB104  [FP-CC1206-1_25-MFG]
C?#2  CC1206KRX7R9BB104  [FP-CC1206-1_25-MFG]
C?#3  CC1206KRX7R9BB104  [FP-CC1206-1_25-MFG]
C?#4  CC1206KRX7R9BB104  [FP-CC1206-1_25-MFG]
C?#5  CC1206KRX7R9BB104  [FP-CC1206-1_25-MFG]
C?#6  CC1206KRX7R9BB104  [FP-CC1206-1_25-MFG]
C?#7  CC1206KRX7R9BB104  [FP-CC1206-1_25-MFG]
C?#8  CC1206KRX7R9BB104  [FP-CC1206-1_25-MFG]
R?#1  RC1206FR-0710KL  [RESC3116X65X40ML10T20]
R?#2  RC1206FR-074K7L  [FP-RC1206-0_65-IPC_B]
R?#3  RC1206FR-0710KL  [RESC3116X65X40ML10T20]
R?#4  RC1206FR-071KL  [RESC3116X65X40ML10T20]
R?#5  RC1206FR-074K7L  [FP-RC1206-0_65-IPC_B]
R?#6  RC1206FR-0710KL  [RESC3116X65X40ML10T20]
R?#7  RC1206FR-0710KL  [RESC3116X65X40ML10T20]
R?#8  RC1206FR-071KL  [RESC3116X65X40ML10T20]
R?#9  RC1206FR-074K7L  [FP-RC1206-0_65-IPC_B]
R?#10  RC1206FR-074K7L  [FP-RC1206-0_65-IPC_B]
U3  ISO1640BDR  [FP-D0008A-IPC_C]
U4  ISO1640BDR  [FP-D0008A-IPC_C]
U5  ISO7721FDR  [FP-D0008A-IPC_B]
U6  ISO7721FDR  [FP-D0008A-IPC_B]

### Ports
B1-, B11, LV_3V3, LV_GND, MCU_U1_ALERT, MCU_U1_RST_SHUT, MCU_U1_SCL, MCU_U1_SDA, MCU_U2_ALERT, MCU_U2_RST_SHUT, MCU_U2_SCL, MCU_U2_SDA, U1_ALERT, U1_I2C_SCL, U1_I2C_SDA, U1_RST_SHUT, U1_VIO_3V3, U2_ALERT, U2_I2C_SCL, U2_I2C_SDA, U2_RST_SHUT, U2_VIO_3V3

### Nets
LV_3V3: C?#1.1 C?#2.1 C?#5.1 C?#7.1 R?#2.2 R?#5.1 R?#9.2 R?#10.1 U3.1(VCC1) U4.1(VCC1) U5.1(VCC1) U6.1(VCC1) ; port LV_3V3  [also labelled U3_VCC1, U4_VCC1, U5_VCC1, U6_VCC1]
LV_GND: C?#1.2 C?#2.2 C?#5.2 C?#7.2 R?#3.2 R?#7.2 U3.4(GND1) U4.4(GND1) U5.4(GND1) U6.4(GND1) ; port LV_GND  [also labelled U3_GND1, U4_GND1, U5_GND1, U6_GND1]
NetLabel13: R?#10.2 U4.3(SCL1) ; port MCU_U1_SCL
NetLabel14: R?#9.1 U4.2(SDA1) ; port MCU_U1_SDA
NetLabel17: R?#5.2 U3.3(SCL1) ; port MCU_U2_SCL
NetLabel18: R?#2.1 U3.2(SDA1) ; port MCU_U2_SDA
U1_I2C_SCL: U4.6(SCL2) ; port U1_I2C_SCL
U1_I2C_SDA: U4.7(SDA2) ; port U1_I2C_SDA
U1_RST_SHUT: R?#8.1 ; port U1_RST_SHUT
U1_VIO_3V3: C?#6.1 C?#8.1 R?#6.2 U4.8(VCC2) U6.8(VCC2) ; port U1_VIO_3V3  [also labelled U6_VCC2]
U2_I2C_SCL: U3.6(SCL2) ; port U2_I2C_SCL
U2_I2C_SDA: U3.7(SDA2) ; port U2_I2C_SDA
U2_RST_SHUT: R?#4.1 ; port U2_RST_SHUT
U2_VIO_3V3: C?#3.1 C?#4.1 R?#1.2 U3.8(VCC2) U5.8(VCC2) ; port U2_VIO_3V3  [also labelled U5_VCC2]
U5_GND2: C?#3.2 C?#4.2 U3.5(GND2) U5.5(GND2) ; port B11  [also labelled VSS_HIGH]  [project net B11]
U5_INA: R?#1.1 U5.7(INA) ; port U2_ALERT  [project net U2_ALERT]
U5_INB: R?#3.1 U5.3(INB) ; port MCU_U2_RST_SHUT  [project net MCU_U2_RST_SHUT]
U5_OUTA: U5.2(OUTA) ; port MCU_U2_ALERT  [project net MCU_U2_ALERT]
U5_OUTB: R?#4.2 U5.6(OUTB)
U6_GND2: C?#6.2 C?#8.2 U4.5(GND2) U6.5(GND2) ; port B1-  [also labelled VSS_LOW]  [project net B1-]
U6_INA: R?#6.1 U6.7(INA) ; port U1_ALERT  [project net U1_ALERT]
U6_INB: R?#7.1 U6.3(INB) ; port MCU_U1_RST_SHUT  [project net MCU_U1_RST_SHUT]
U6_OUTA: U6.2(OUTA) ; port MCU_U1_ALERT  [project net MCU_U1_ALERT]
U6_OUTB: R?#8.2 U6.6(OUTB)

### Notes on the sheet
- Labels drawn without touching a wire or pin: U1 — ALERT ve RESET BESLEME-SİNYAL DEVRELERİ, U1 — ALERT ve Reset İzolasyonu, U1--İzole I²C Haberleşmesi, U1_BESLEME_DEVRESİ, U2 — ALERT ve RESET BESLEME-SİNYAL DEVRELERİ, U2 — ALERT ve Reset İzolasyonu, U2--İzole I²C Haberleşmesi, U2_BESLEME_DEVRESİ

### Library data of the parts
C?#1-C?#8 = CMP-03422-000842-1: as C26 on sheet 20_BQ76952; Temperature Characteristic: X7R; Device Class L1: Passive Components; Lead Free: Yes; Octopart: https://octopart.com/cc1206krx7r9bb104-yageo-39467816; Category: Cap; Temperature Range Low: -55°C; Device Class L3: Ceramic Capacitors; Voltage Rating: 50 V; Temperature Range High: +125°C; Device Class L2: Capacitors; RoHS: TRUE; Package: CC1206-1.25; Footprint Url: http://www.yageo.com/exep/pages/download/literatures/UPY-C_GEN_24.pdf; ComponentLink2Description: Datasheet; Temperature: -55°C to +125°C; Capacitance: 100 nF; Digikey Description: CAP CER 0.1UF 50V X7R 1206; Height: 1.45mm; Automotive: No; Mouser Description: Multilayer Ceramic Capacitors MLCC - SMD/SMT 100nF 50V X7R 10%; ComponentLink2URL: http://www.yageo.com/documents/recent/UPY-NP0X7R_HV_1KV-to-3KV_11.pdf; Manufacturer Part Number: CC1206KRX7R9BB104
R?#1 R?#3 R?#6 R?#7 = CMP-1014-00623-2: as R29 on sheet 20_BQ76952; Packaging: TapeandReel; Termination: SMD/SMT; REACH SVHC: Unknown; Tolerance: 1%; Height: 0.55mm; Composition: ThickFilm; Max Operating Temperature: 155degC; Datasheet Version: Rev. 5, 10/2016; Lead Free: LeadFree; Case Code (Metric): 3216; Depth: 1.6mm; Package Quantity: 5000; RoHSCompliant: true; Military Standard: Not; Case/Package: 1206; Case Code (Imperial): 1206; Min Operating Temperature: -55degC; Datasheet URL: http://www.yageo.com/NewPortal/yageodocoutput?fileName=/pdf/R-Chip/PYu-RC_Group_51_RoHS_L_5.pdf; Length: 3.1mm; Manufacturer URL: http://www.yageo.com/; Package Reference: 1206.0; Width: 1.6mm; Package Description: 2-Pin Surface Mount Device, Body 3.1 x 1.6 mm
R?#2 R?#5 R?#9 R?#10 = CMP-03412-037805-1: as R27 on sheet 20_BQ76952; Construction: Rectangular; RoHS Compliant: Yes; Max Operating Temperature: 155°C; Tolerance: 1%; Height: 0.026inch; Features: Moisture Resistant; Military Standard: Not; Series: RC; Termination: SMD/SMT; Number of Terminations: 2; Number of Pins: 2; Case Code (Imperial): 1206; Case/Package: 1206; Case Code (Metric): 3216; Voltage Rating (DC): 200V; Width: 0.063inch; Min Operating Temperature: -55°C; Resistance Tolerance: 1%; Length: 0.122inch; Size Code: 1206; Lead Free: Lead Free; Depth: 1.6mm; Packaging: Tape and Reel; Package Quantity: 1; Power Rating: 250mW; Resistor Type: Thick Film
R?#4 R?#8 = CMP-2100-03678-1: Chip Resistor, 1 KOhm, +/- 1%, 0.25 W, -55 to 155 degC, 1206 (3216 Metric), RoHS, Tape and Reel; Manufacturer: Yageo; Temperature Coefficient: 100ppm/degreesC; Power Rating: 250mW; Voltage Rating: 200V; Resistance: 1KOhm; Composition: ThickFilm; Min Operating Temperature: -55degC; Tolerance: 1%; REACH SVHC: Unknown; Case Code (Metric): 3216; Military Standard: Not; Datasheet Version: Rev. 5, 10/2016; Package Reference: 1206.0; Case/Package: 1206; Length: 3.1mm; Manufacturer URL: http://www.yageo.com/; Lead Free: LeadFree; RoHSCompliant: true; Termination: SMD/SMT; Packaging: TapeandReel; Package Description: 2-Pin Surface Mount Device, Body 3.1 x 1.6 mm; Depth: 1.6mm; Case Code (Imperial): 1206; Max Operating Temperature: 155degC; Datasheet URL: http://www.yageo.com/NewPortal/yageodocoutput?fileName=/pdf/R-Chip/PYu-RC_Group_51_RoHS_L_5.pdf; Height: 0.55mm
U3 U4 = CMP-04872-000071-1: ROBUST-EMC BIDIRECTIONAL I2C DIG; RoHS Compliant: Yes
U5 U6 = CMP-04872-000124-1: DGTL ISO 3000VRMS 2CH GP 8SOIC; Number of Channels: 2; Isolated Power: No; Propagation Delay: 16ns; Channel Type: Unidirectional; Data Rate: 100Mbps; Pulse Width Distortion (PWD): 4.9ns; Packaging: Tape and Reel; Mount: Surface Mount; Case/Package: SOIC; RoHS Compliant: Yes; Min Operating Temperature: -55°C; Max Operating Temperature: 125°C; Type: General Purpose; Number of Pins: 8

## Nets that join several sheets
B1-: 10_CELL_MONITOR (R6.1), 20_BQ76952 (16 pins), 30_AFE_COMM (C?#6.2 C?#8.2 U4.5 U6.5)
B11: 10_CELL_MONITOR (R12.1), 20_BQ76952 (21 pins), 30_AFE_COMM (C?#3.2 C?#4.2 U3.5 U5.5)
B22: 10_CELL_MONITOR (R23.1), 20_BQ76952 (D2.2 R35.2)
U1_ALERT: 20_BQ76952 (U1.25), 30_AFE_COMM (R?#6.1 U6.7)
U1_CELL0: 10_CELL_MONITOR (C6.1 R6.2), 20_BQ76952 (C29.1 U1.16)
U1_CELL1: 10_CELL_MONITOR (C1.1 C6.2 R7.2), 20_BQ76952 (U1.15)
U1_CELL2: 10_CELL_MONITOR (C1.2 C2.1 R1.2), 20_BQ76952 (U1.14)
U1_CELL3: 10_CELL_MONITOR (C2.2 C3.1 R2.2), 20_BQ76952 (U1.13)
U1_CELL4: 10_CELL_MONITOR (C3.2 C4.1 R3.2), 20_BQ76952 (U1.12)
U1_CELL5: 10_CELL_MONITOR (C4.2 C5.1 R4.2), 20_BQ76952 (U1.11)
U1_CELL6: 10_CELL_MONITOR (C5.2 C7.1 R5.2), 20_BQ76952 (U1.10)
U1_CELL7: 10_CELL_MONITOR (C7.2 C8.1 R8.2), 20_BQ76952 (U1.9)
U1_CELL8: 10_CELL_MONITOR (C8.2 C9.1 R9.2), 20_BQ76952 (U1.8)
U1_CELL9: 10_CELL_MONITOR (C9.2 C10.1 R10.2), 20_BQ76952 (U1.7)
U1_CELL10: 10_CELL_MONITOR (C10.2 C11.1 R11.2), 20_BQ76952 (6 pins)
U1_CELL11: 10_CELL_MONITOR (C11.2 R12.2), 20_BQ76952 (U1.48)
U1_I2C_SCL: 20_BQ76952 (R27.1 U1.26), 30_AFE_COMM (U4.6)
U1_I2C_SDA: 20_BQ76952 (R28.1 U1.27), 30_AFE_COMM (U4.7)
U1_RST_SHUT: 20_BQ76952 (C30.1 R30.2 U1.33), 30_AFE_COMM (R?#8.1)
U1_VIO_3V3: 20_BQ76952 (R27.2 R28.2), 30_AFE_COMM (5 pins)
U2_ALERT: 20_BQ76952 (U2.25), 30_AFE_COMM (R?#1.1 U5.7)
U2_CELL11: 10_CELL_MONITOR (C12.1), 20_BQ76952 (C36.1 R34.1 U2.16)
U2_CELL12: 10_CELL_MONITOR (C12.2 C18.1 R13.2), 20_BQ76952 (U2.15)
U2_CELL13: 10_CELL_MONITOR (C13.1 C18.2 R19.2), 20_BQ76952 (U2.14)
U2_CELL14: 10_CELL_MONITOR (C13.2 C14.1 R14.2), 20_BQ76952 (U2.13)
U2_CELL15: 10_CELL_MONITOR (C14.2 C15.1 R15.2), 20_BQ76952 (U2.12)
U2_CELL16: 10_CELL_MONITOR (C15.2 C16.1 R16.2), 20_BQ76952 (U2.11)
U2_CELL17: 10_CELL_MONITOR (C16.2 C17.1 R17.2), 20_BQ76952 (U2.10)
U2_CELL18: 10_CELL_MONITOR (C17.2 C19.1 R18.2), 20_BQ76952 (U2.9)
U2_CELL19: 10_CELL_MONITOR (C19.2 C20.1 R20.2), 20_BQ76952 (U2.8)
U2_CELL20: 10_CELL_MONITOR (C20.2 C21.1 R21.2), 20_BQ76952 (U2.7)
U2_CELL21: 10_CELL_MONITOR (C21.2 C22.1 R22.2), 20_BQ76952 (6 pins)
U2_CELL22: 10_CELL_MONITOR (C22.2 R23.2), 20_BQ76952 (U2.48)
U2_I2C_SCL: 20_BQ76952 (R32.1 U2.26), 30_AFE_COMM (U3.6)
U2_I2C_SDA: 20_BQ76952 (R33.1 U2.27), 30_AFE_COMM (U3.7)
U2_RST_SHUT: 20_BQ76952 (C37.1 R36.2 U2.33), 30_AFE_COMM (R?#4.1)
U2_VIO_3V3: 20_BQ76952 (R32.2 R33.2), 30_AFE_COMM (5 pins)